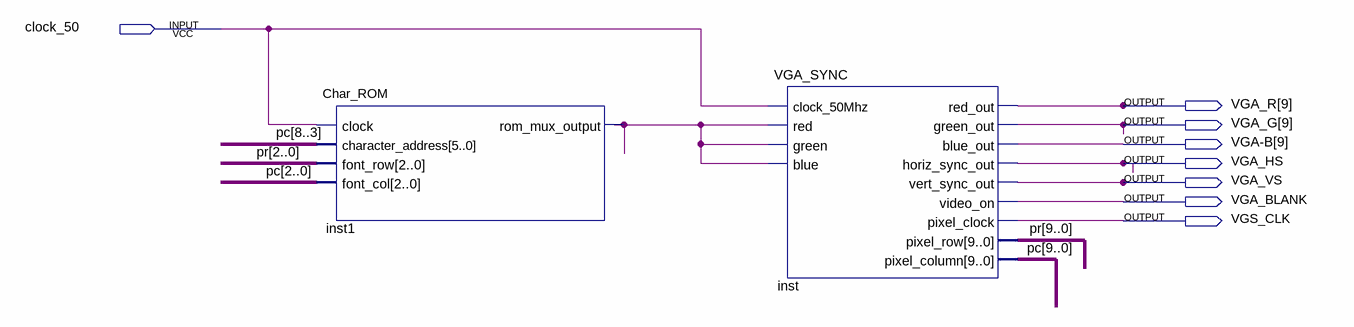
[diagram p0: schematic sheet]
// Quartus schematic Project1.bdf as structural Verilog: 2 symbols, 8 pins
module Project1 (
  input  clock_50,
  output [9:9] VGA_R,
  output [9:9] VGA_G,
  output [9:9] \VGA-B ,
  output VGA_HS,
  output VGA_VS,
  output VGA_BLANK,
  output VGS_CLK
);

  wire inst1_rom_mux_output;
  wire [9:0] pc, pr;

  Char_ROM inst1 (
    .clock(clock_50), .character_address(pc[8:3]), .font_row(pr[2:0]), .font_col(pc[2:0]),
    .rom_mux_output(inst1_rom_mux_output));
  VGA_SYNC inst (
    .clock_50Mhz(clock_50), .red(inst1_rom_mux_output), .green(inst1_rom_mux_output),
    .blue(inst1_rom_mux_output), .red_out(VGA_R[9]), .green_out(VGA_G[9]), .blue_out(\VGA-B [9]),
    .horiz_sync_out(VGA_HS), .vert_sync_out(VGA_VS), .video_on(VGA_BLANK), .pixel_clock(VGS_CLK),
    .pixel_row(pr), .pixel_column(pc));
endmodule
